# Altium schematic sheet Connectors.SchDoc
size A4; SheetNumber: 3; SheetTotal: 6
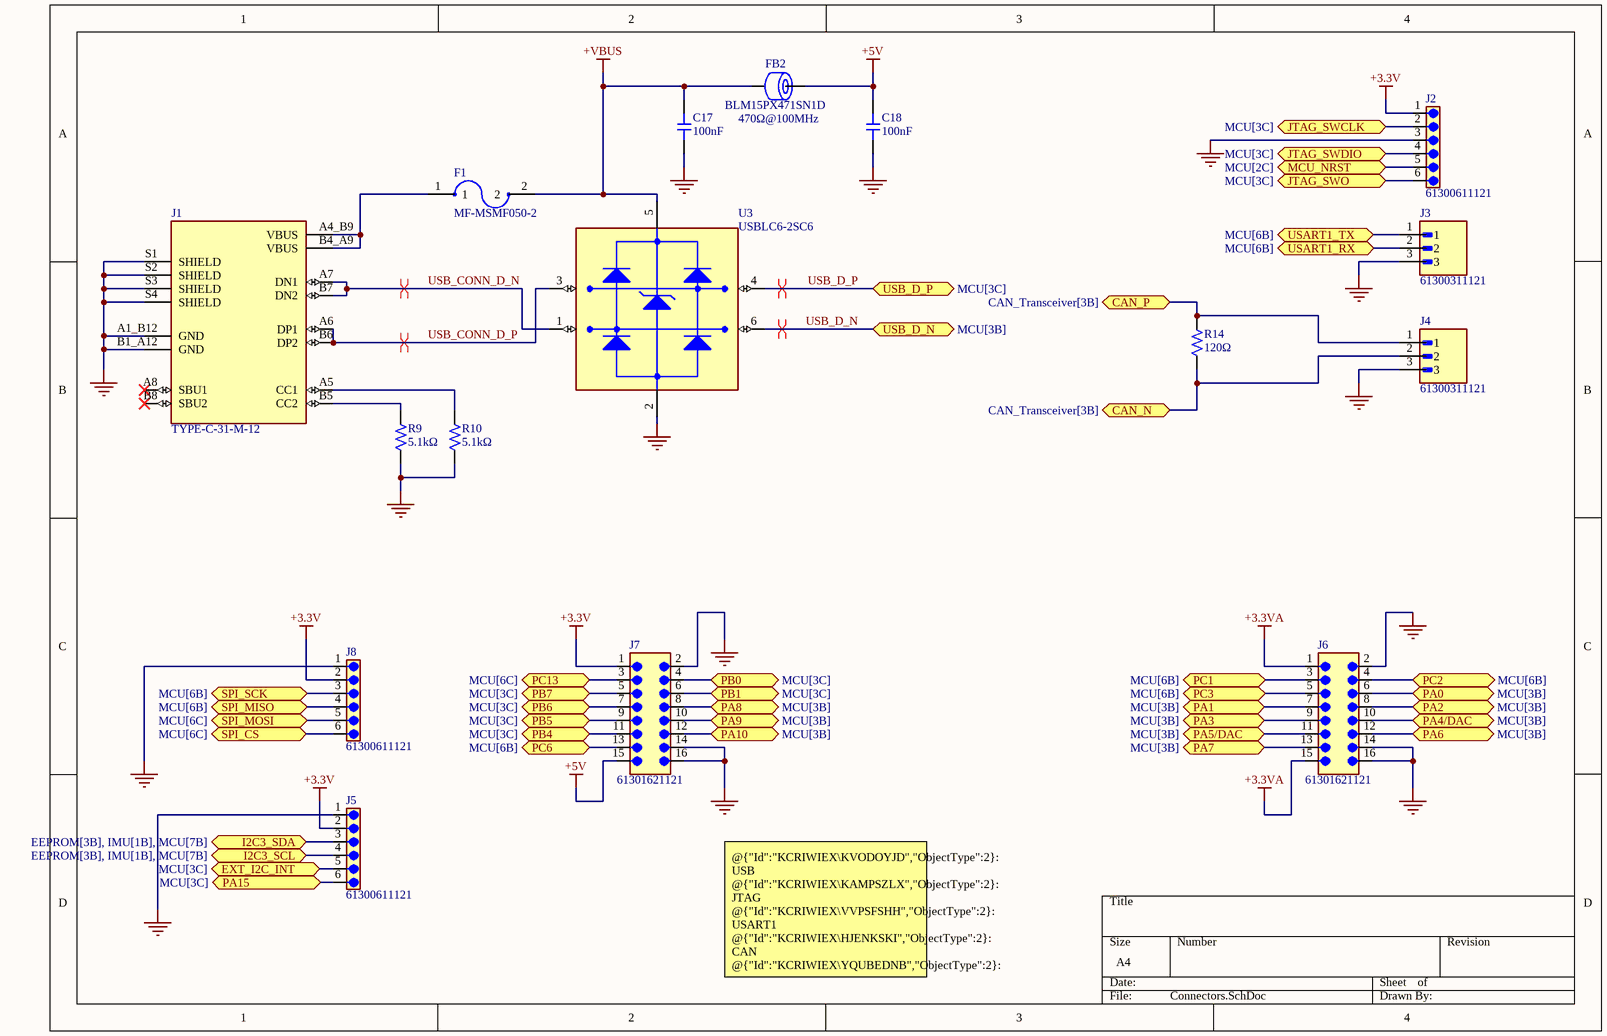
[diagram p0: Connectors.SchDoc]

## Parts
C17  Capacitance: 100nF  [CAP-0402]  (hidden comment: CL05B104KO5NNNC)
C18  Capacitance: 100nF  [CAP-0402]  (hidden comment: CL05B104KO5NNNC)
F1  MF-MSMF050-2  [FUSM4632X85]
FB2  BLM15PX471SN1D  Impedance @ Frequency: 470Ω@100MHz  [FB-0402]
J1  TYPE-C-31-M-12  [HRO_TYPE-C-31-M-12]
J2  61300611121  [61300611121]
J3  61300311121  [WURTH_61300311121]
J4  61300311121  [WURTH_61300311121]
J5  61300611121  [61300611121]
J6  61301621121  [61301621121]
J7  61301621121  [61301621121]
J8  61300611121  [61300611121]
R9  Resistance: 5.1kΩ  [RES-0402]  (hidden comment: 0402WGF5101TCE)
R10  Resistance: 5.1kΩ  [RES-0402]  (hidden comment: 0402WGF5101TCE)
R14  Resistance: 120Ω  [RES-0402]  (hidden comment: 0402WGF1200TCE)
U3  USBLC6-2SC6  [SOT95P280X145-6N]

## Ports
CAN_N (bidir, see CAN_Transceiver[3B]), CAN_P (bidir, see CAN_Transceiver[3B]), EXT_I2C_INT (bidir, see MCU[3C]), I2C3_SCL (bidir, see EEPROM[3B], IMU[1B], MCU[7B]), I2C3_SDA (bidir, see EEPROM[3B], IMU[1B], MCU[7B]), JTAG_SWCLK (bidir, see MCU[3C]), JTAG_SWDIO (bidir, see MCU[3C]), JTAG_SWO (bidir, see MCU[3C]), MCU_NRST (bidir, see MCU[2C]), PA0 (bidir, see MCU[3B]), PA1 (bidir, see MCU[3B]), PA2 (bidir, see MCU[3B]), PA3 (bidir, see MCU[3B]), PA4/DAC (bidir, see MCU[3B]), PA5/DAC (bidir, see MCU[3B]), PA6 (bidir, see MCU[3B]), PA7 (bidir, see MCU[3B]), PA8 (bidir, see MCU[3B]), PA9 (bidir, see MCU[3B]), PA10 (bidir, see MCU[3B]), PA15 (bidir, see MCU[3C]), PB0 (bidir, see MCU[3C]), PB1 (bidir, see MCU[3C]), PB4 (bidir, see MCU[3C]), PB5 (bidir, see MCU[3C]), PB6 (bidir, see MCU[3C]), PB7 (bidir, see MCU[3C]), PC1 (bidir, see MCU[6B]), PC2 (bidir, see MCU[6B]), PC3 (bidir, see MCU[6B]), PC6 (bidir, see MCU[6B]), PC13 (bidir, see MCU[6C]), SPI_CS (bidir, see MCU[6C]), SPI_MISO (bidir, see MCU[6B]), SPI_MOSI (bidir, see MCU[6C]), SPI_SCK (bidir, see MCU[6B]), USART1_RX (bidir, see MCU[6B]), USART1_TX (bidir, see MCU[6B]), USB_D_N (bidir, see MCU[3B]), USB_D_P (bidir, see MCU[3C])

## Nets
+3.3V: J2.1 J5.2 J7.1 J8.2
+3.3VA: J6.1 J6.15
+5V: C18.2 FB2.2 J7.15
+VBUS: C17.2 F1.2 FB2.1 U3.5(VBUS)
GND: C17.1 C18.1 J1.A1_B12(GND) J1.B1_A12(GND) J1.S1(SHIELD) J1.S2(SHIELD) J1.S3(SHIELD) J1.S4(SHIELD) J2.3 J3.3 J4.3 J5.1 J6.2 J6.14 J6.16 J7.2 J7.14 J7.16 J8.1 R9.1 R10.1 U3.2(GND)
CAN_N: J4.2 R14.1 ; port CAN_N
CAN_P: J4.1 R14.2 ; port CAN_P
EXT_I2C_INT: J5.5 ; port EXT_I2C_INT
I2C3_SCL: J5.4 ; port I2C3_SCL
I2C3_SDA: J5.3 ; port I2C3_SDA
JTAG_SWCLK: J2.2 ; port JTAG_SWCLK
JTAG_SWDIO: J2.4 ; port JTAG_SWDIO
JTAG_SWO: J2.6 ; port JTAG_SWO
MCU_NRST: J2.5 ; port MCU_NRST
PA0: J6.6 ; port PA0
PA1: J6.7 ; port PA1
PA2: J6.8 ; port PA2
PA3: J6.9 ; port PA3
PA4/DAC: J6.10 ; port PA4/DAC
PA5/DAC: J6.11 ; port PA5/DAC
PA6: J6.12 ; port PA6
PA7: J6.13 ; port PA7
PA8: J7.8 ; port PA8
PA9: J7.10 ; port PA9
PA10: J7.12 ; port PA10
PA15: J5.6 ; port PA15
PB0: J7.4 ; port PB0
PB1: J7.6 ; port PB1
PB4: J7.11 ; port PB4
PB5: J7.9 ; port PB5
PB6: J7.7 ; port PB6
PB7: J7.5 ; port PB7
PC1: J6.3 ; port PC1
PC2: J6.4 ; port PC2
PC3: J6.5 ; port PC3
PC6: J7.13 ; port PC6
PC13: J7.3 ; port PC13
SPI_CS: J8.6 ; port SPI_CS
SPI_MISO: J8.4 ; port SPI_MISO
SPI_MOSI: J8.5 ; port SPI_MOSI
SPI_SCK: J8.3 ; port SPI_SCK
USART1_RX: J3.2 ; port USART1_RX
USART1_TX: J3.1 ; port USART1_TX
USB_CONN_D_N: J1.A7(DN1) J1.B7(DN2) U3.1(I/O1_IN)
USB_CONN_D_P: J1.A6(DP1) J1.B6(DP2) U3.3(I/O2_IN)
USB_D_N: U3.6(I/O1_OUT) ; port USB_D_N
USB_D_P: U3.4(I/O2_OUT) ; port USB_D_P
NetF1_1: F1.1 J1.A4_B9(VBUS) J1.B4_A9(VBUS)
NetJ1_A5: J1.A5(CC1) R10.2
NetJ1_B5: J1.B5(CC2) R9.2

Not connected (* = marked no-connect by the designer): J1 A8(SBU1)* B8(SBU2)*

## Layout directives
differential pair; differential pair class DIFF_USB: USB_CONN_D_N, USB_CONN_D_P, USB_D_N, USB_D_P

## Notes on the sheet
- @{"Id":"KCRIWIEX\KVODOYJD","ObjectType":2}: USB
  @{"Id":"KCRIWIEX\KAMPSZLX","ObjectType":2}: JTAG
  @{"Id":"KCRIWIEX\VVPSFSHH","ObjectType":2}: USART1
  @{"Id":"KCRIWIEX\HJENKSKI","ObjectType":2}: CAN
  @{"Id":"KCRIWIEX\YQUBEDNB","ObjectType":2}: I2C3
  @{"Id":"KCRIWIEX\OTQHTWFR","ObjectType":2}: Analog
  @{"Id":"KCRIWIEX\IUIQBGCT","ObjectType":2}: PWM / Timer
  @{"Id":"KCRIWIEX\MERWTRKB","ObjectType":2}: SPI3

## Library data of the parts
C17 C18 = CL05B104KO5NNNC: Capacitor, Ceramic (MLCC), 100nF, ±10%, 16V, X7R, ±10%, SMD 0402; Manufacturer: Samsung Electro-Mechanics; Temperature Rating: -55°C ~ 125°C; Capacitance @ 1V DC Bias: 104.721nF; Capacitance @ 1.2V DC Bias: 104.598nF; Capacitance @ 1.35V DC Bias: 104.495nF; Capacitance @ 1.5V DC Bias: 104.372nF; Capacitance @ 1.8V DC Bias: 104.042nF; Capacitance @ 2.5V DC Bias: 102.634nF; Capacitance @ 3.3V DC Bias: 100.452nF; Capacitance @ 3.7V DC Bias: 99.160nF; Capacitance @ 4.2V DC Bias: 97.441nF; Capacitance @ 5V DC Bias: 94.577nF; Capacitance @ 9V DC Bias: 78.638nF; Capacitance @ 12V DC Bias: 66.291nF; Capacitance @ 15V DC Bias: 54.779nF; Impedance (0V Bias) @ 100Hz: 1.71E+04Ω; Impedance (0V Bias) @ 500Hz: 3.48E+03Ω; Impedance (0V Bias) @ 1kHz: 1.75E+03Ω; Impedance (0V Bias) @ 5kHz: 356Ω; Impedance (0V Bias) @ 10kHz: 179Ω; Impedance (0V Bias) @ 50kHz: 36.4Ω; Impedance (0V Bias) @ 100kHz: 18.3Ω; Impedance (0V Bias) @ 500kHz: 3.72Ω; Impedance (0V Bias) @ 1MHz: 1.87Ω; Impedance (0V Bias) @ 5MHz: 0.373Ω; Impedance (0V Bias) @ 10MHz: 0.175Ω; Impedance (0V Bias) @ 50MHz: 0.064Ω; Impedance (0V Bias) @ 100MHz: 0.122Ω; Impedance (0V Bias) @ 500MHz: 0.525Ω; Impedance (0V Bias) @ 1GHz: 0.97Ω; Impedance (0V Bias) @ 2GHz: 2.26Ω; Impedance (0V Bias) @ 5GHz: 4.75Ω; Impedance (16V Bias) @ 100Hz: 2.55E+04Ω; Impedance (16V Bias) @ 500Hz: 5.18E+03Ω; Impedance (16V Bias) @ 1kHz: 2.61E+03Ω; Impedance (16V Bias) @ 5kHz: 529Ω; Impedance (16V Bias) @ 10kHz: 266Ω; Impedance (16V Bias) @ 50kHz: 54Ω; Impedance (16V Bias) @ 100kHz: 27.2Ω; Impedance (16V Bias) @ 500kHz: 5.5Ω; Impedance (16V Bias) @ 1MHz: 2.76Ω; Impedance (16V Bias) @ 5MHz: 0.587Ω; Impedance (16V Bias) @ 10MHz: 0.277Ω; Impedance (16V Bias) @ 50MHz: 0.0412Ω; Impedance (16V Bias) @ 100MHz: 0.133Ω; Impedance (16V Bias) @ 500MHz: 0.524Ω; Impedance (16V Bias) @ 1GHz: 0.969Ω; Impedance (16V Bias) @ 2GHz: 2.25Ω; Impedance (16V Bias) @ 5GHz: 4.7Ω; Package Size: 0402; JLCPCB Basic Part: Yes; JLCPCB Part Number: C1525; Supplier 1: LCSC; Category: Capacitors - MLCC; Supplier Part Number 1: C1525; Manufacturer Part Number: CL05B104KO5NNNC; Tolerance: ±10%; Voltage Rating: 16V; Temperature Coefficient: X7R; RoHS: Yes; ComponentLink1Description: Datasheet; ComponentLink1URL: https://wmsc.lcsc.com/wmsc/upload/file/pdf/v2/lcsc/2304140030_Samsung-Electro-Mechanics-CL05B104KO5NNNC_C1525.pdf; ComponentLink2Description: JLCPCB Part URL; ComponentLink2URL: https://jlcpcb.com/partdetail/C1525; ComponentLink3Description: LCSC Part URL; ComponentLink3URL: https://lcsc.com/product-detail/Multilayer-Ceramic-Capacitors-MLCC---SMD-SMT_Samsung-Electro-Mechanics-Samsung-Electro-Mechanics-CL05B104KO5NNNC_C1525.html; ComponentLink4Description: Samsung Component Library; ComponentLink4URL: https://weblib.samsungsem.com/mlcc/mlcc-ec.do?partNumber=CL05B104KO5NNN
F1 = MF-MSMF050-2: Polymeric PTC Resettable Fuse 15V 500 mA Ih Surface Mount 1812 (4532 Metric), Concave; MF: Bourns; MP: MF-MSMF050-2; Availability: In Stock; Check_prices: https://www.snapeda.com/parts/MF-MSMF050-2/Bourns+-+J.W.+Miller/view-part/?ref=eda; Price: None; Package: 1812 Bourns; Purchase-URL: https://pricing.snapeda.com/search/part/MF-MSMF050-2/?ref=eda; Value: *; SnapEDA_Link: https://www.snapeda.com/parts/MF-MSMF050-2/Bourns+-+J.W.+Miller/view-part/?ref=snap
FB2 = BLM15PX471SN1D: Ferrite, 470Ω@100MHz, ±25%, 200mΩ, 1A, SMD 0402; Manufacturer: Murata Electronics; Package Size: 0402; JLCPCB Basic Part: No; JLCPCB Part Number: C333978; Supplier 1: LCSC; Category: Ferrite Beads; Supplier Part Number 1: C333978; Manufacturer Part Number: BLM15PX471SN1D; Tolerance: ±25%; Rated Current: 1A; DC Resistance: 200mΩ; RoHS: Yes; ComponentLink1Description: Datasheet; ComponentLink1URL: https://wmsc.lcsc.com/wmsc/upload/file/pdf/v2/lcsc/1912111437_Murata-Electronics-BLM15PX471SN1D_C333978.pdf; ComponentLink2Description: JLCPCB Part URL; ComponentLink2URL: https://jlcpcb.com/partdetail/C333978; ComponentLink3Description: LCSC Part URL; ComponentLink3URL: https://lcsc.com/product-detail/Ferrite-Beads_Murata-Electronics-Murata-Electronics-BLM15PX471SN1D_C333978.html
J1 = TYPE-C-31-M-12: USB Connectors 24 Receptacle 1 8.94*7.3mm RoHS; MF: HRO Electronics Co., Ltd.; SnapEDA_Link: https://www.snapeda.com/parts/TYPE-C-31-M-12/HRO+Electronics+Co.%252C+Ltd./view-part/?ref=snap; Package: Package; Value: *; MP: TYPE-C-31-M-12; Check_prices: https://www.snapeda.com/parts/TYPE-C-31-M-12/HRO+Electronics+Co.%252C+Ltd./view-part/?ref=eda
J2 J5 J8 = 61300611121: Header, 6 pins, 2.54mm; MF: {'manufacturer': u'Wurth Electronics'}; Package: None; Price: None; Value: *; MP: 61300611121; Availability: Unavailable
J3 J4 = 61300311121: Header, 3 pins, 2.54mm; Package: None; Price: None; Value: *; MP: 61300311121; Availability: Unavailable
J6 J7 = 61301621121: Header, 2x8 pins, 2.54mm; MF: {'manufacturer': u'W\xfcrth Elektronik'}; Package: None; Price: None; Value: *; MP: 61301621121; Availability: Unavailable
R9 R10 = 0402WGF5101TCE: Resistor, 5.1kΩ, ±1%, 62.5mW, 50V, ±100ppm/℃, -55℃~+155℃, SMD 0402; Manufacturer: Uniroyal; Supplier 1: LCSC; Manufacturer Part Number: 0402WGF5101TCE; Supplier Part Number 1: C25905; JLCPCB Part Number: C25905; Power Rating: 62.5mW; Category: Resistors; Package Size: 0402; JLCPCB Basic Part: Yes; Tolerance: ±1%; Voltage Rating: 50V; Temperature Coefficient: ±100ppm/℃; Temperature Rating: -55℃~+155℃; ComponentLink1Description: Datasheet; ComponentLink1URL: https://wmsc.lcsc.com/wmsc/upload/file/pdf/v2/lcsc/2206010045_UNI-ROYAL-Uniroyal-Elec-0402WGF5101TCE_C25905.pdf; ComponentLink2Description: JLCPCB Part URL; ComponentLink2URL: https://jlcpcb.com/partdetail/C25905
R14 = 0402WGF1200TCE: Resistor, 120Ω, ±1%, 62.5mW, 50V, ±100ppm/℃, -55℃~+155℃, SMD 0402; Manufacturer: Uniroyal; Supplier 1: LCSC; Manufacturer Part Number: 0402WGF1200TCE; Supplier Part Number 1: C25079; JLCPCB Part Number: C25079; Power Rating: 62.5mW; Category: Resistors; Package Size: 0402; JLCPCB Basic Part: Yes; Tolerance: ±1%; Voltage Rating: 50V; Temperature Coefficient: ±100ppm/℃; Temperature Rating: -55℃~+155℃; ComponentLink1Description: Datasheet; ComponentLink1URL: https://wmsc.lcsc.com/wmsc/upload/file/pdf/v2/lcsc/2205311900_UNI-ROYAL-Uniroyal-Elec-0402WGF1200TCE_C25079.pdf; ComponentLink2Description: JLCPCB Part URL; ComponentLink2URL: https://jlcpcb.com/partdetail/C25079
U3 = USBLC6-2SC6: 17V Clamp 5A (8/20Âµs) Ipp Tvs Diode Surface Mount SOT-23-6; MF: STMicroelectronics; Value: *; SnapEDA_Link: https://www.snapeda.com/parts/USBLC6-2SC6/STMicroelectronics/view-part/?ref=snap; Check_prices: https://www.snapeda.com/parts/USBLC6-2SC6/STMicroelectronics/view-part/?ref=eda; Purchase-URL: https://pricing.snapeda.com/search/part/USBLC6-2SC6/?ref=eda; Price: None; Availability: In Stock; Package: SOT-23-6 STMicroelectronics; MP: USBLC6-2SC6